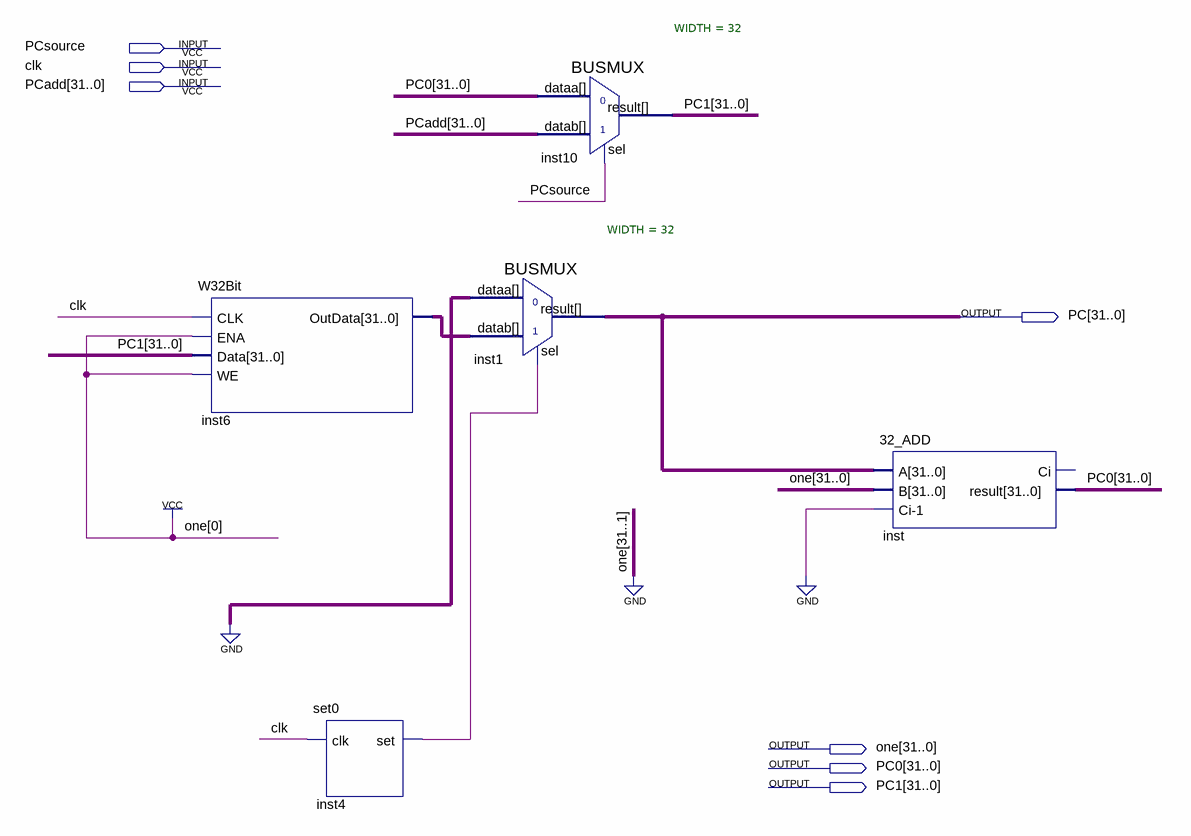
[diagram p0: schematic sheet]
// Quartus schematic PC.bdf as structural Verilog: 5 symbols, 7 pins
module PC (
  input  PCsource,
  input  clk,
  input  [31:0] PCadd,
  output [31:0] PC,
  output [31:0] one,
  output [31:0] PC0,
  output [31:0] PC1
);

  wire inst4_set;
  wire [31:0] inst6_outdata;

  W32Bit inst6 (.CLK(clk), .ENA(1'b1), .Data(PC1), .WE(1'b1), .OutData(inst6_outdata));
  set0 inst4 (.clk(clk), .set(inst4_set));
  BUSMUX #(.WIDTH(32)) inst1 (.datab(inst6_outdata), .sel(inst4_set), .dataa({32{1'b0}}), .result(PC));
  BUSMUX #(.WIDTH(32)) inst10 (.datab(PCadd), .sel(PCsource), .dataa(PC0), .result(PC1));
  \32_ADD  inst (.A(PC), .B(32'b00000000000000000000000000000001), .\Ci-1 (1'b0), .result(PC0));  // open: Ci

  assign one = 32'b00000000000000000000000000000001;
endmodule
